# Altium schematic sheet MCU.SchDoc
size 381 x 241 mm; SheetNumber: 3; SheetTotal: 7
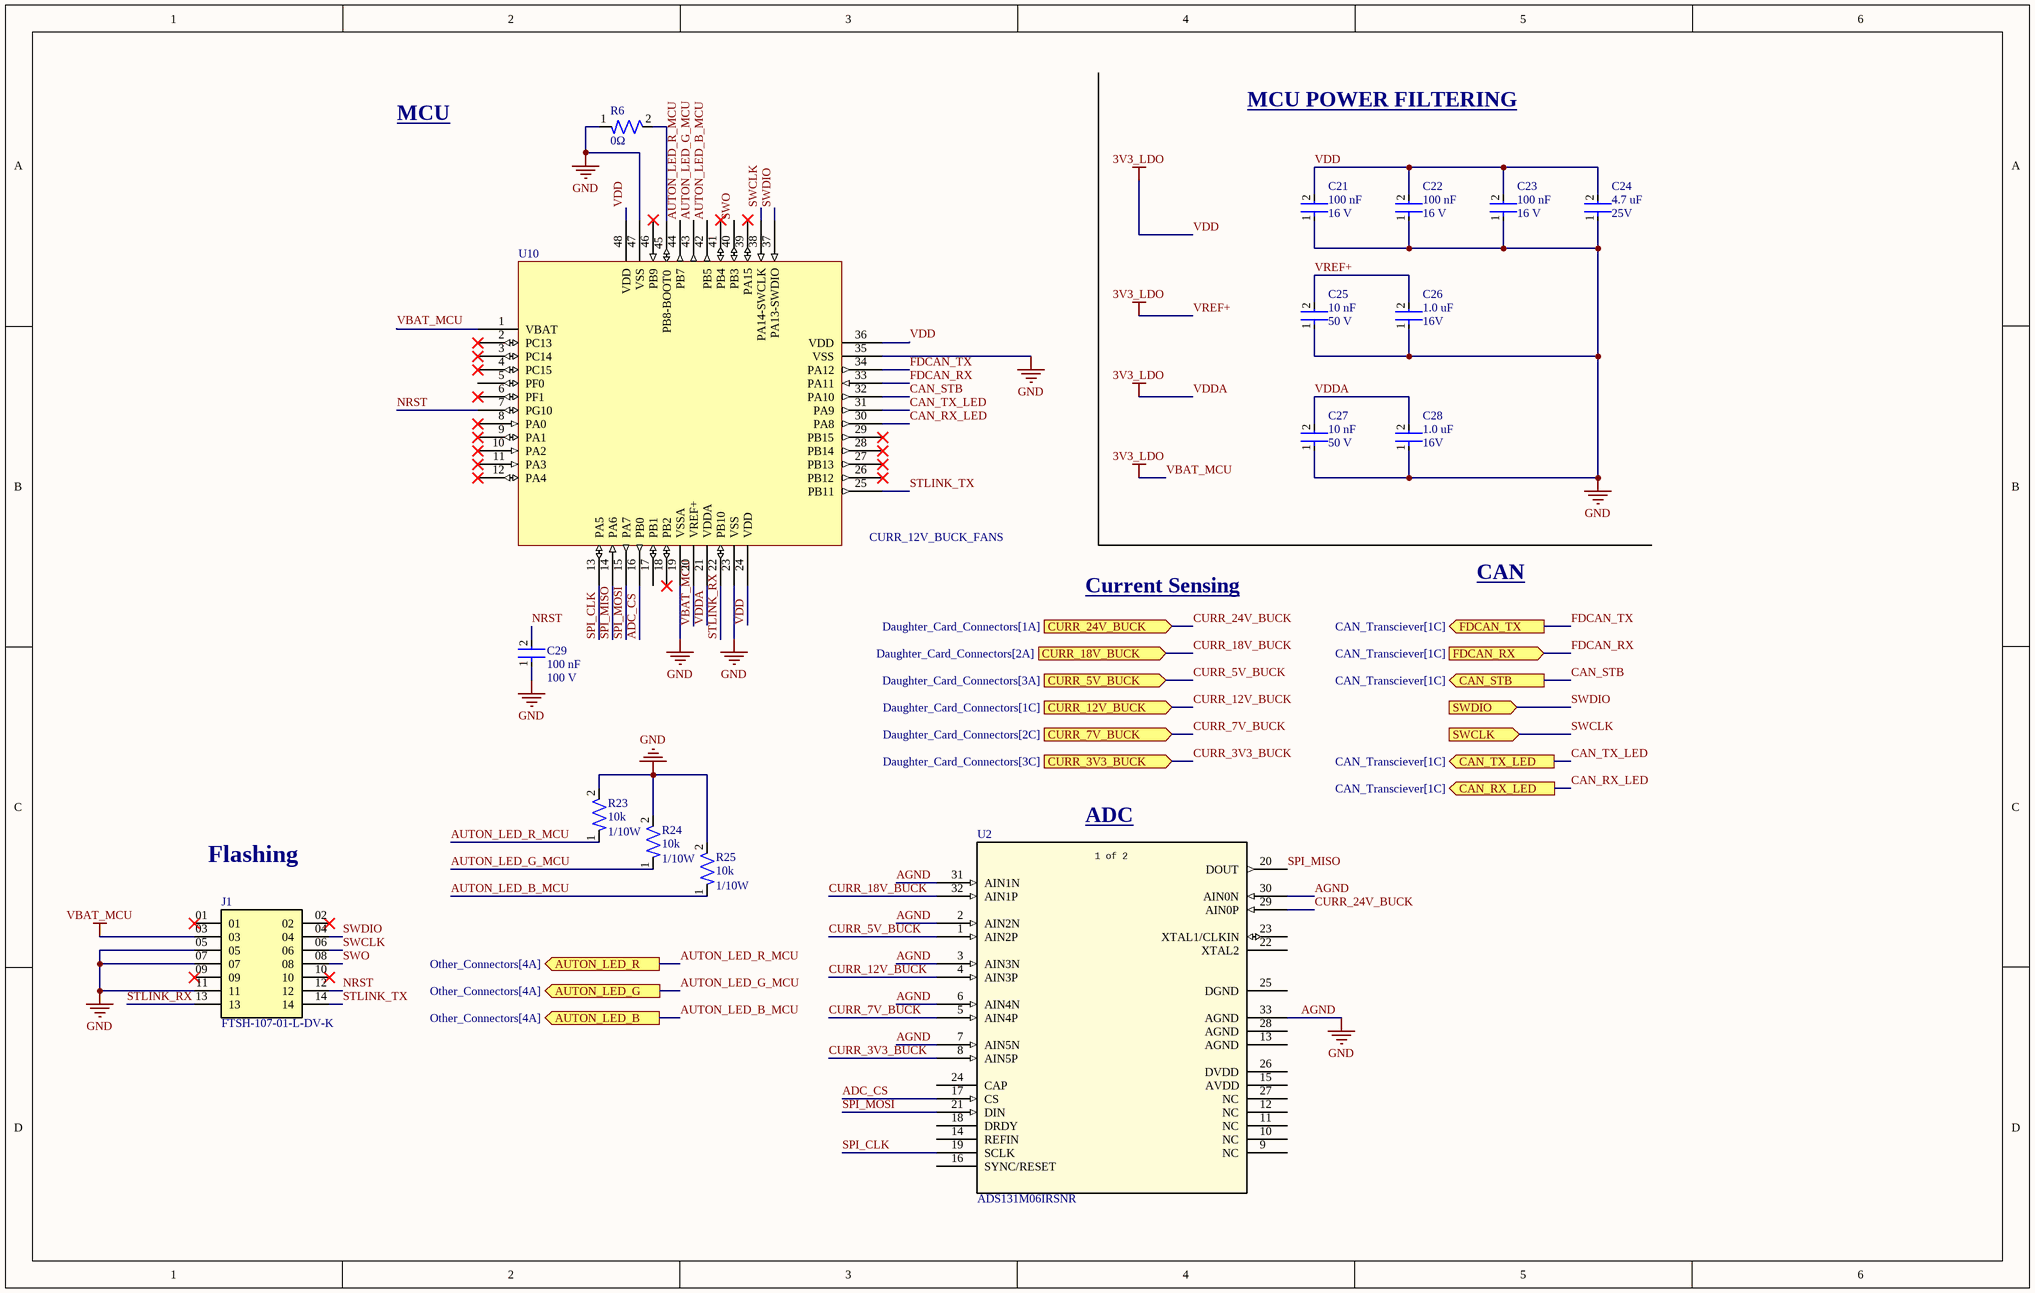
[diagram p0: MCU.SchDoc]

## Parts
C21  Capacitance: 100 nF  Voltage Rating: 16 V  [CAP-0603]  (hidden comment: CC0603KRX7R7BB104)
C22  Capacitance: 100 nF  Voltage Rating: 16 V  [CAP-0603]  (hidden comment: CC0603KRX7R7BB104)
C23  Capacitance: 100 nF  Voltage Rating: 16 V  [CAP-0603]  (hidden comment: CC0603KRX7R7BB104)
C24  Capacitance: 4.7 uF  Voltage: 25V  [CAP-0603]  (hidden comment: CC0603KRX5R8BB475)
C25  Voltage: 50 V  Capacitance: 10 nF  [CAP-0603]  (hidden comment: CC0603KPX7R9BB103)
C26  Capacitance: 1.0 uF  Voltage: 16V  [CAP-0603]  (hidden comment: CC0603KRX7R7BB105)
C27  Voltage: 50 V  Capacitance: 10 nF  [CAP-0603]  (hidden comment: CC0603KPX7R9BB103)
C28  Capacitance: 1.0 uF  Voltage: 16V  [CAP-0603]  (hidden comment: CC0603KRX7R7BB105)
C29  Capacitance: 100 nF  Voltage: 100 V  [CAP-0603]  (hidden comment: CC0603KRX7R0BB104)
J1  FTSH-107-01-L-DV-K  [SAMTEC_FTSH-107-01-L-DV-K]
R6  Resistance: 0Ω  [RES-0603]  (hidden comment: CRF2010-J/-000ELF)
R23  Resistance: 10k  Power: 1/10W  [RES-0603]  (hidden comment: RC0603JR-0710KL)
R24  Resistance: 10k  Power: 1/10W  [RES-0603]  (hidden comment: RC0603JR-0710KL)
R25  Resistance: 10k  Power: 1/10W  [RES-0603]  (hidden comment: RC0603JR-0710KL)
U2  ADS131M06IRSNR  [QFN_M06IRSNR_TEX]
U10  STM32G431CBT6  [IC-LQFP48]  (value not drawn)

## Ports
AUTON_LED_B (out, see Other_Connectors[4A]), AUTON_LED_G (out, see Other_Connectors[4A]), AUTON_LED_R (out, see Other_Connectors[4A]), CAN_RX_LED (out, see CAN_Transciever[1C]), CAN_STB (out, see CAN_Transciever[1C]), CAN_TX_LED (out, see CAN_Transciever[1C]), CURR_3V3_BUCK (in, see Daughter_Card_Connectors[3C]), CURR_5V_BUCK (in, see Daughter_Card_Connectors[3A]), CURR_7V_BUCK (in, see Daughter_Card_Connectors[2C]), CURR_12V_BUCK (in, see Daughter_Card_Connectors[1C]), CURR_18V_BUCK (in, see Daughter_Card_Connectors[2A]), CURR_24V_BUCK (in, see Daughter_Card_Connectors[1A]), FDCAN_RX (in, see CAN_Transciever[1C]), FDCAN_TX (out, see CAN_Transciever[1C]), SWCLK (in), SWDIO (in)

## Nets
AGND: C21.1 C22.1 C23.1 C24.1 C25.1 C26.1 C27.1 C28.1 C29.1 J1.05 J1.07 J1.11 R6.1 R23.2 R24.2 R25.2 U2.2(AIN2N) U2.3(AIN3N) U2.6(AIN4N) U2.7(AIN5N) U2.30(AIN0N) U2.31(AIN1N) U2.33(AGND) U10.19(VSSA) U10.23(VSS) U10.35(VSS) U10.47(VSS)  [also labelled GND]
VBAT_MCU: C21.2 C22.2 C23.2 C24.2 C25.2 C26.2 C27.2 C28.2 J1.03 U10.1(VBAT) U10.20(VREF+) U10.21(VDDA) U10.24(VDD) U10.36(VDD) U10.48(VDD)  [also labelled 3V3_LDO, VDD, VDDA, VREF+]
ADC_CS: U2.17(CS) U10.16(PB0)
AUTON_LED_B_MCU: R25.1 U10.42(PB5) ; port AUTON_LED_B
AUTON_LED_G_MCU: R24.1 U10.43(PB6) ; port AUTON_LED_G
AUTON_LED_R_MCU: R23.1 U10.44(PB7) ; port AUTON_LED_R
CAN_RX_LED: U10.30(PA8) ; port CAN_RX_LED
CAN_STB: U10.32(PA10) ; port CAN_STB
CAN_TX_LED: U10.31(PA9) ; port CAN_TX_LED
CURR_3V3_BUCK: U2.8(AIN5P) ; port CURR_3V3_BUCK
CURR_5V_BUCK: U2.1(AIN2P) ; port CURR_5V_BUCK
CURR_7V_BUCK: U2.5(AIN4P) ; port CURR_7V_BUCK
CURR_12V_BUCK: U2.4(AIN3P) ; port CURR_12V_BUCK
CURR_18V_BUCK: U2.32(AIN1P) ; port CURR_18V_BUCK
CURR_24V_BUCK: U2.29(AIN0P) ; port CURR_24V_BUCK
FDCAN_RX: U10.33(PA11) ; port FDCAN_RX
FDCAN_TX: U10.34(PA12) ; port FDCAN_TX
NRST: C29.2 J1.12 U10.7(PG10)
SPI_CLK: U2.19(SCLK) U10.13(PA5)
SPI_MISO: U2.20(DOUT) U10.14(PA6)
SPI_MOSI: U2.21(DIN) U10.15(PA7)
STLINK_RX: J1.13 U10.22(PB10)
STLINK_TX: J1.14 U10.25(PB11)
SWCLK: J1.06 U10.38(PA14-SWCLK) ; port SWCLK
SWDIO: J1.04 U10.37(PA13-SWDIO) ; port SWDIO
SWO: J1.08 U10.40(PB3)
NetR6_2: R6.2 U10.45(PB8-BOOT0)

Not connected (* = marked no-connect by the designer): J1 01* 02* 09* 10*; U2 9(NC) 10(NC) 11(NC) 12(NC) 13(AGND) 14(REFIN) 15(AVDD) 16(SYNC/RESET) 18(DRDY) 22(XTAL2) 23(XTAL1/CLKIN) 24(CAP) 25(DGND) 26(DVDD) 27(NC) 28(AGND); U10 2(PC13)* 3(PC14)* 4(PC15)* 5(PF0) 6(PF1)* 8(PA0)* 9(PA1)* 10(PA2)* 11(PA3)* 12(PA4)* 17(PB1) 18(PB2)* 26(PB12)* 27(PB13)* 28(PB14)* 29(PB15)* 39(PA15)* 41(PB4)* 46(PB9)*

## Notes on the sheet
- MCU
- MCU POWER FILTERING
- (near U10) CURR_12V_BUCK_FANS
- Current Sensing
- CAN
- (near U2) ADC
- Flashing
- (in symbol ADS131M06IRSNR) 1 of 2

## Library data of the parts
C21-C23 = CAP-0.1U-0003: 0.1 µF ±10% 16V Ceramic Capacitor X7R 0603 (1608 Metric)
C24 = CAP-4.7U-0001: CAP CER 4.7UF 25V X5R 0603; Device Class: Ceramic; Size: 0603
C25 C27 = CAP-10N-0002: CAP CER 10000PF 50V X7R 0603; ComponentLink2Description: Datasheet; ComponentLink2URL: http://www.yageo.com/documents/recent/UPY-GPHC_X7R_6.3V-to-50V_18.pdf; Device Class: Ceramic; Size: 0603
C26 C28 = CAP-1U-0002: CAP CER 1UF 16V X7R 0603; Device Class: Ceramic; Size: 0603
C29 = CAP-100N-0001: CAP CER 0.1UF 100V X7R 0603; Device Class: Ceramic; Size: 0603; ComponentLink1Description: Datasheet; ComponentLink1URL: https://www.yageo.com/upload/media/product/app/datasheet/mlcc/upy-np0x7r_mv_100-to-630v.pdf
J1 = CONN_Flashing-0001: Connector Header Surface Mount 14 position 0.050" (1.27mm); MF: Samtec; Value: *; Price: None; Package: None; Availability: Unavailable; MP: FTSH-107-01-L-DV-K; ComponentLink1Description: Datasheet; ComponentLink1URL: https://mm.digikey.com/Volume0/opasdata/d220001/medias/docus/6209/ftsh-1xx-xx-xxx-dv-xxx-xxx-x-xx-mkt.pdf
R6 = RES-0-0001: 0 Ohms Jumper Chip Resistor 2010 (5025 Metric) Automotive AEC-Q200 Metal Element; Tolerance: 1%; Size: 0603; ComponentLink1Description: Datasheet; ComponentLink1URL: https://www.yageo.com/upload/media/product/products/datasheet/rchip/PYu-RC_Group_51_RoHS_L_12.pdf
R23-R25 = RES-10k-0002: RES SMD 10kO 5% 1/10W 0603; Manufacturer_Name: Yageo; Copyright: Copyright (C) 2025 Ultra Librarian. All rights reserved.; Manufacturer_Part_Number: RC0603JR-0710KL
U2 = ADS131M06IRSNR: Six-channel, 24-bit, 32-kSPS, simultaneous-sampling, delta-sigma ADC 32-QFN -40 to 125; Manufacturer_Name: Texas Instruments; Copyright: Copyright (C) 2026 Ultra Librarian. All rights reserved.; Manufacturer_Part_Number: ADS131M06IRSNR; RefDes: RefDes; Type: Type
U10 = IC-STM32G431CBT6: IC MCU 32BIT 128KB FLASH 48LQFP; Package: 48LQFP; ComponentLink1Description: Datasheet; ComponentLink1URL: https://www.st.com/resource/en/datasheet/stm32g431cb.pdf